# Altium project lga1700.PrjPCB (part 8 of 11)

## Sheet PCH_PWR - 0.82V_1.05V_1.8V.schdoc
size 594 x 421 mm; Symbol: Sheet-Symbol_A2; Company: 嘉立创EDA; Version: V1.0; Page Size: A2; @Project Name: H610(2024/12/09); @Page Count: 36; @Update Date: 2025-10-09; @Create Date: 2025-10-09; @Schematic Name: SCHEMATIC1; @Page No: 35; @Page Name: PCH_PWR - 0.82V/1.05V/1.8V; Device: Sheet-Symbol_A2; @Board Name: SCHEMATIC1; @Create Time: 10:15:43; @Update Time: 10:18:21
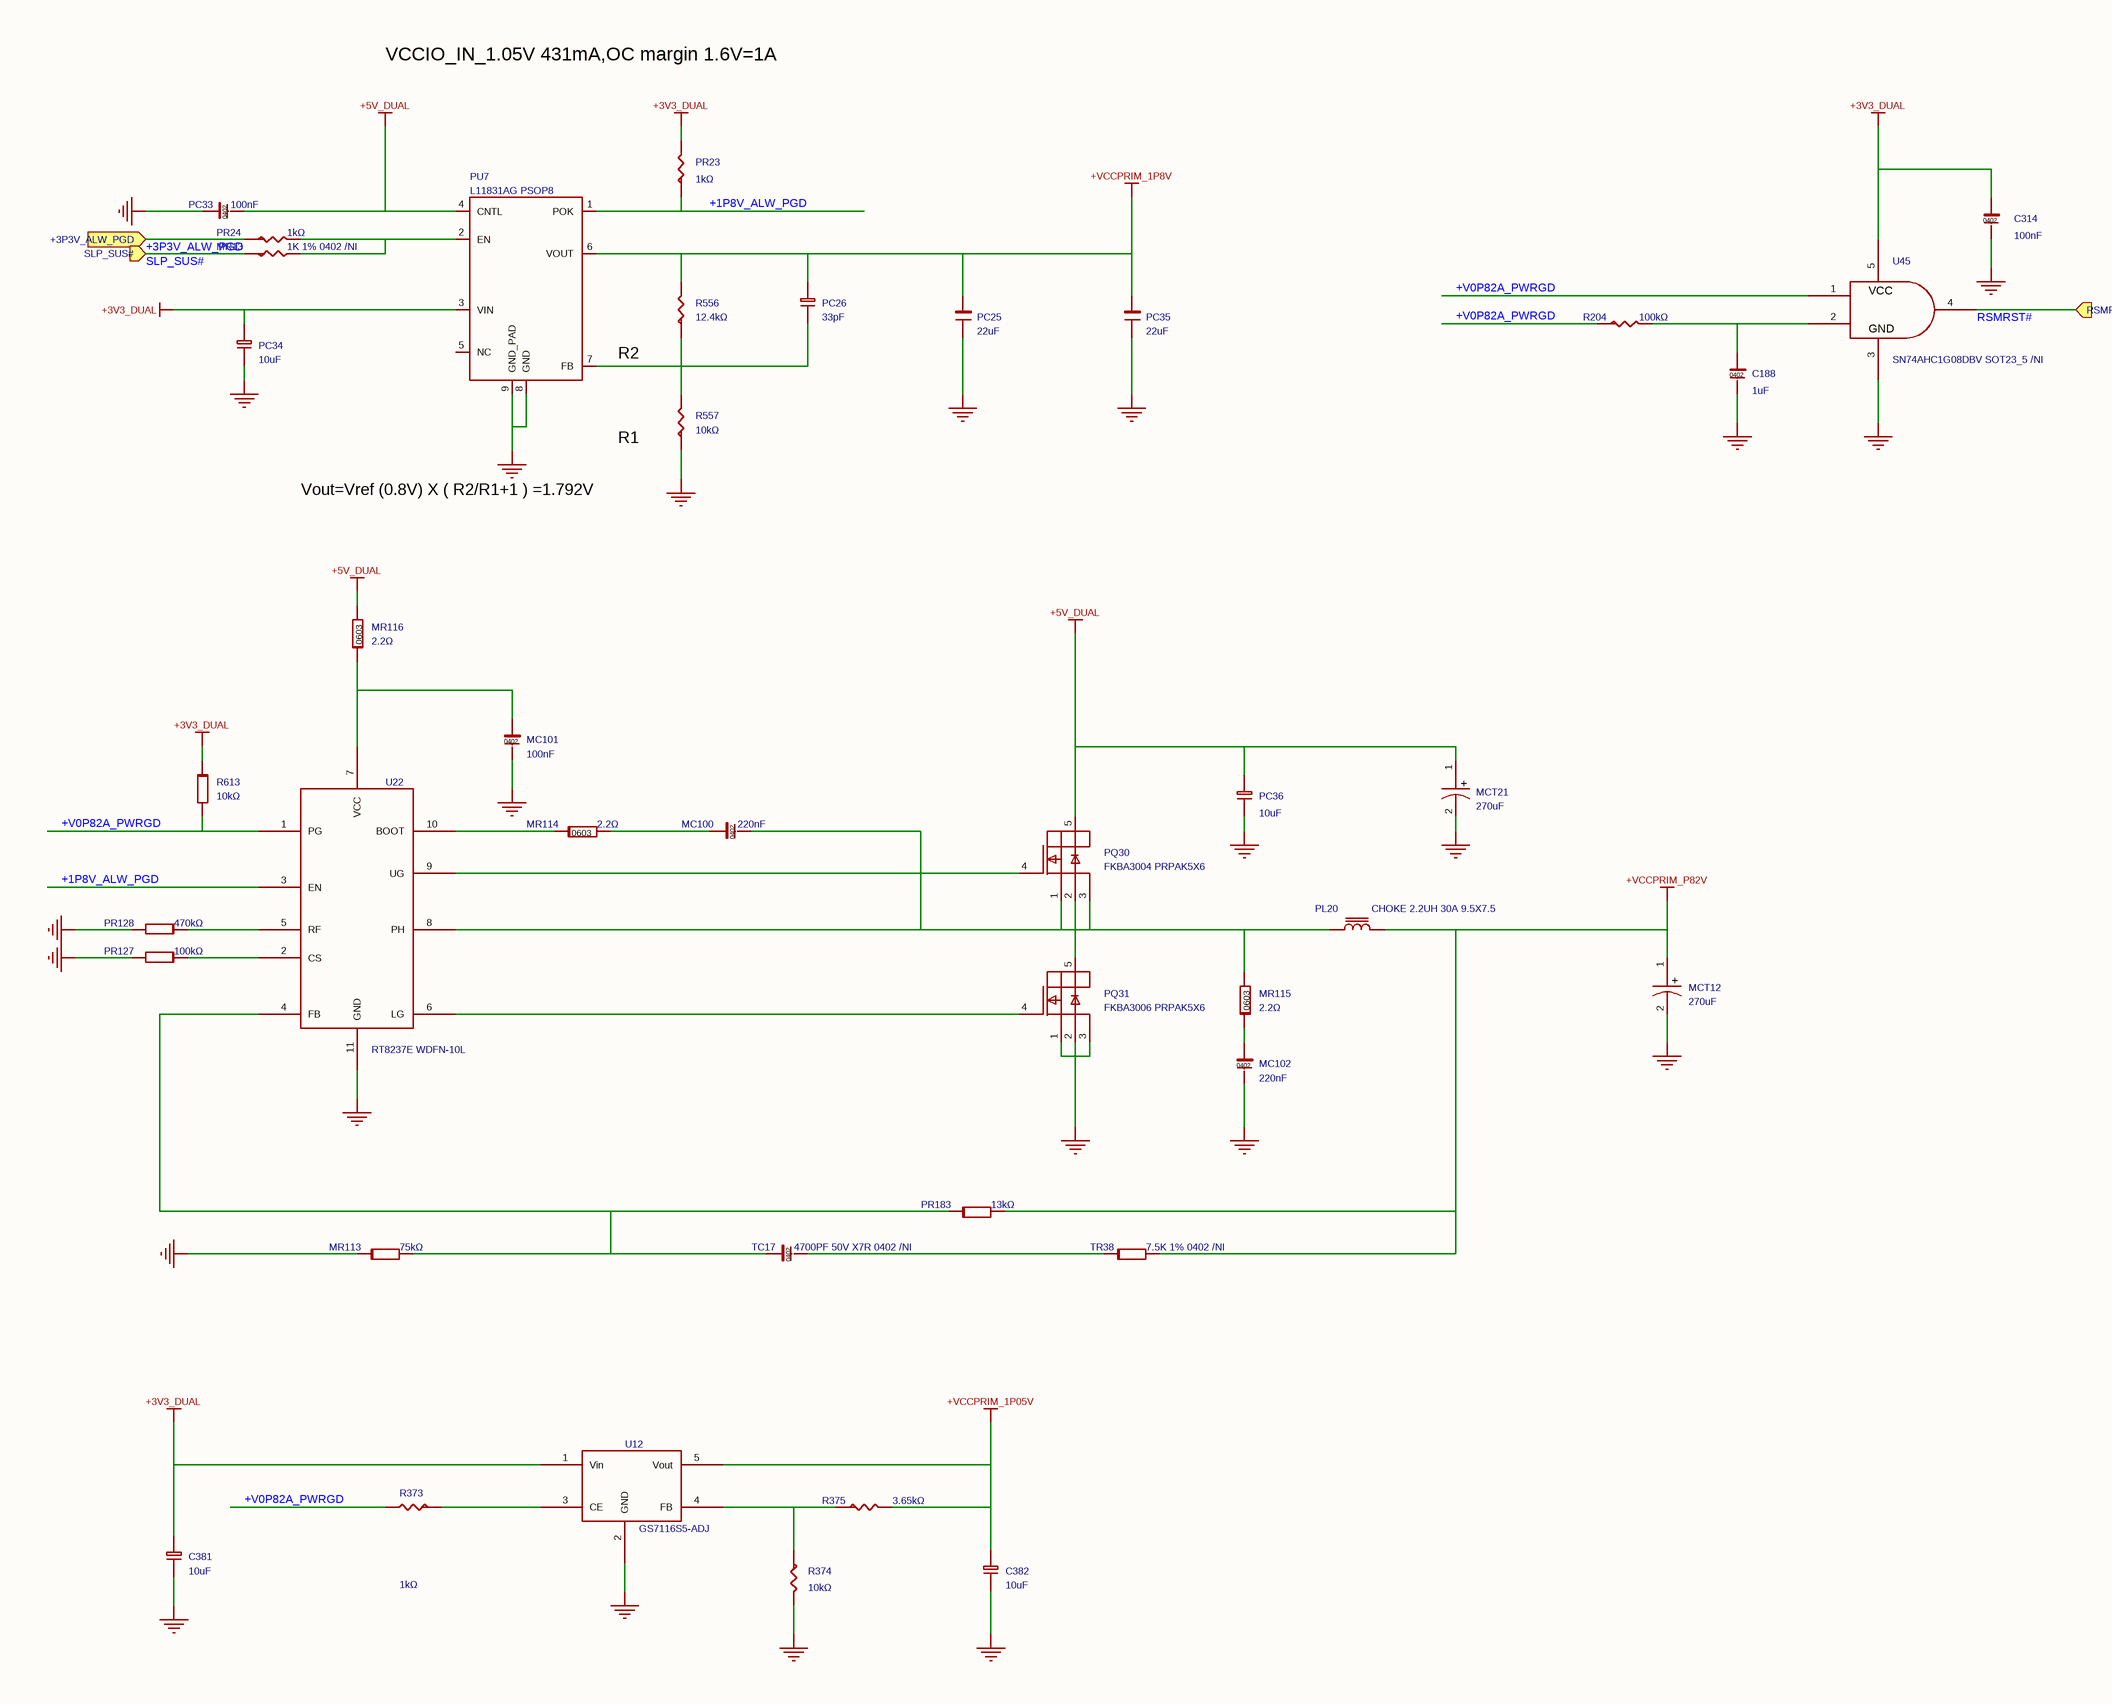
[diagram p27: PCH_PWR - 0.82V_1.05V_1.8V.schdoc]

### Parts
C188  1uF  [C0402_2]
C314  100nF  [C0402_2]
C381  10uF  [C0603_2]
C382  10uF  [C0603_1]
MC100  220nF  [C0402_2]
MC101  100nF  [C0402]
MC102  220nF  [C0402_1]
MCT12  270uF  [EC1P25C_2]
MCT21  270uF  [EC1P25C_2]
MR13  value 1K 1% 0402 /NI  [R0402_3]  (hidden comment: R-0603)
MR113  75kΩ  [R0402]
MR114  2.2Ω  [R0603]
MR115  2.2Ω  [R0603_2]
MR116  2.2Ω  [R0603]
PC25  22uF  [C0603_2]
PC26  33pF  [C0402_1]
PC33  100nF  [C0402_2]
PC34  10uF  [C0603_1]
PC35  22uF  [C0603_2]
PC36  10uF  [C0805_1]
PL20  value CHOKE 2.2UH 30A 9.5X7.5  [CHOKE2U8-20A_3P_1]  (hidden comment: L_L70-P50-H70)
PQ30  value FKBA3004 PRPAK5X6  [PRPAK5X6_6]  (hidden comment: PK616BA)
PQ31  value FKBA3006 PRPAK5X6  [PRPAK5X6_6]  (hidden comment: PK616BA)
PR23  1kΩ  [R0402]
PR24  1kΩ  [R0402_2]
PR127  100kΩ  [R0402_2]
PR128  470kΩ  [R0402_2]
PR183  13kΩ  [R0402_3]
PU7  value L11831AG PSOP8  [SO8_50_150GV_1]  (hidden comment: RT9173B_0)
R204  100kΩ  [R0402]
R373  1kΩ  [R0402_1]
R374  10kΩ  [R0402_3]
R375  3.65kΩ  [R0402_1]
R556  12.4kΩ  [R0402_3]
R557  10kΩ  [R0402]
R613  10kΩ  [R0402_2]
TC17  value 4700PF 50V X7R 0402 /NI  [C0402_2]  (hidden comment: C0402)
TR38  value 7.5K 1% 0402 /NI  [R0402_3]  (hidden comment: R0402)
U12  value GS7116S5-ADJ  [SM_SOT23_5PIN]  (hidden comment: 2280005000G_0)
U22  value RT8237E WDFN-10L  [DFN3X3-10-0-5_2]  (hidden comment: RT8237EZQW)
U45  value SN74AHC1G08DBV SOT23_5 /NI  [SM_SOT23_5PIN]  (hidden comment: 74AHC1G08_2)

### Ports
+3P3V_ALW_PGD (in), RSMRST# (in), SLP_SUS# (in)

### Nets
+3V3_DUAL: C314.1 C381.1 PC34.1 PR23.2 PU7.3(VIN) R613.1 U12.1(Vin) U45.5(VCC)
+5V_DUAL: MCT21.1 MR116.2 PC33.2 PC36.2 PQ30.5(DRAIN1) PU7.4(CNTL)
+VCCPRIM_1P05V: C382.1 R375.2 U12.5(Vout)
+VCCPRIM_1P8V: PC25.1 PC26.2 PC35.1 PU7.6(VOUT) R556.2
+VCCPRIM_P82V: MCT12.1 PL20.2 PR183.2 TR38.2
GND: C188.2 C314.2 C381.2 C382.2 MC101.2 MC102.2 MCT12.2 MCT21.2 MR113.1 PC25.2 PC33.1 PC34.2 PC35.2 PC36.1 PQ31.1(SOURCE1) PQ31.2(SOURCE2) PQ31.3(SOURCE3) PR127.2 PR128.2 PU7.8(GND) PU7.9(GND_PAD) R374.2 R557.1 U12.2(GND) U22.11(GND) U45.3(GND)
+1P8V_ALW_PGD: PR23.1 PU7.1(POK) U22.3(EN)
+3P3V_ALW_PGD: PR24.1 ; port +3P3V_ALW_PGD
+V0P82A_PWRGD: R204.1 R373.2 R613.2 U22.1(PG) U45.1(I0)
RSMRST#: U45.4(O) ; port RSMRST#
SLP_SUS#: MR13.1 ; port SLP_SUS#
NetC188_1: C188.1 R204.2 U45.2(I1)
NetMC100_1: MC100.1 MR114.2
NetMC100_2: MC100.2 MR115.2 PL20.1 PQ30.1(SOURCE1) PQ30.2(SOURCE2) PQ30.3(SOURCE3) PQ31.5(DRAIN1) U22.8(PH)
NetMC101_1: MC101.1 MR116.1 U22.7(VCC)
NetMC102_1: MC102.1 MR115.1
NetMR13_2: MR13.2 PR24.2 PU7.2(EN)
NetMR113_2: MR113.2 PR183.1 TC17.1 U22.4(FB)
NetMR114_1: MR114.1 U22.10(BOOT)
NetPC26_1: PC26.1 PU7.7(FB) R556.1 R557.2
NetPQ30_4: PQ30.4(GATE) U22.9(UG)
NetPQ31_4: PQ31.4(GATE) U22.6(LG)
NetPR127_1: PR127.1 U22.2(CS)
NetPR128_1: PR128.1 U22.5(RF)
NetR373_1: R373.1 U12.3(CE)
NetR374_1: R374.1 R375.1 U12.4(FB)
NetTC17_2: TC17.2 TR38.1

Not connected (* = marked no-connect by the designer): PU7 5(NC)

### Notes on the sheet
- VCCIO_IN_1.05V 431mA,OC margin 1.6V=1A
- R2
- R1
- Vout=Vref (0.8V) X ( R2/R1+1 ) =1.792V
- 更新日期
- 2025-10-09
- 原理图
- 图页
- SCHEMATIC1
- PCH_PWR - 0.82V/1.05V/1.8V
- 创建日期
- 物料编码
- 审阅
- 绘制
- H610(2024/12/09)
- 版本
- V1.0
- 尺寸
- A2
- 页
- 35
- 嘉立创EDA
- 共
- 36
- (in symbol 160AREC271M0609) +

### Library data of the parts
C188 = CL05A105KQ5NNNC: 容值:1uF;精度:±10%;额定电压:6.3V;材质(温度系数):X5R;; Manufacturer: SAMSUNG(三星); Symbol: C0402; AddInBom: yes; ModelId: 36a51122f27c49738f86b3bfa98863e0; ModelName: C0402_L1.0-W0.5-H0.5; ModelTransform: 39.37,19.685,0,0,0,0,0,0,0; Tolerance: ±10%; Voltage Rated: 6.3V; Temperature Coefficient: X5R; Device: CL05A105KQ5NNNC; Value: 1uF; LCSC Part Name: 1uF ±10% 6.3V; SupplierPart: C107372; ManufacturerPart: CL05A105KQ5NNNC; Supplier Footprint: 0402; JLCPCB Part Class: Extended Part; Datasheet: https://atta.szlcsc.com/upload/public/pdf/source/20160218/1457707763339.pdf; Supplier: LCSC; ConvertToPcb: yes; FootprintName: C0402_2
C314 PC33 = CL05B104KO5NNNC: as C237-C240 on sheet LAN - RTL8111H; Device: CL05B104KO5NNNC; Value: 100nF; Supplier: LCSC; Datasheet: https://atta.szlcsc.com/upload/public/pdf/source/20160103/1457707674891.pdf; FootprintName: C0402_2; SupplierPart: C1525; ConvertToPcb: yes; LCSC Part Name: 100nF ±10% 16V; JLCPCB Part Class: Basic Part; ManufacturerPart: CL05B104KO5NNNC; Supplier Footprint: 0402
C381 C382 PC34 = CL10A106MQ8NNNC: 容值:10uF;精度:±20%;额定电压:6.3V;材质(温度系数):X5R;; Manufacturer: SAMSUNG(三星); Symbol: CAP; PCB Footprint: C0603; Tolerance: ±20%; ModelId: ac125912035d415993ca9572d50418b1; AddInBom: yes; Voltage Rated: 6.3V; ModelName: C0603_L1.6-W0.8-H0.8; ModelTransform: 62.992,31.496,0,0,0,0,0,0,0; Temperature Coefficient: X5R; Device: CL10A106MQ8NNNC; Value: 10uF; Supplier: LCSC; Datasheet: https://atta.szlcsc.com/upload/public/pdf/source/20160103/1457707690948.pdf; SupplierPart: C1691; ConvertToPcb: yes; LCSC Part Name: 10uF ±20% 6.3V; JLCPCB Part Class: Extended Part; ManufacturerPart: CL10A106MQ8NNNC; Supplier Footprint: 0603
  C381: FootprintName: C0603_2
  C382 PC34: FootprintName: C0603_1
MC100 MC102 = CL05B224KO5NNNC: 容值:220nF;精度:±10%;额定电压:16V;材质(温度系数):X7R;; Manufacturer: SAMSUNG(三星); Symbol: C0402; ModelId: 36a51122f27c49738f86b3bfa98863e0; Tolerance: ±10%; AddInBom: yes; Voltage Rated: 16V; ModelName: C0402_L1.0-W0.5-H0.5; ModelTransform: 39.37,19.685,0,0,0,0,0,0,0; Temperature Coefficient: X7R; Device: CL05B224KO5NNNC; Value: 220nF; Supplier: LCSC; Datasheet: https://atta.szlcsc.com/upload/public/pdf/source/20160103/1457707689724.pdf; SupplierPart: C16772; ConvertToPcb: yes; LCSC Part Name: 220nF ±10% 16V; JLCPCB Part Class: Basic Part; ManufacturerPart: CL05B224KO5NNNC; Supplier Footprint: 0402
  MC100: FootprintName: C0402_2
  MC102: FootprintName: C0402_1
MC101 = CL05B104KO5NNNC: as C334 on sheet M.2_SATA_SLOT; Device: CL05B104KO5NNNC; Symbol: C0402; Value: 100nF; Supplier: LCSC; Datasheet: https://atta.szlcsc.com/upload/public/pdf/source/20160103/1457707674891.pdf; FootprintName: C0402; SupplierPart: C1525; ConvertToPcb: yes; LCSC Part Name: 100nF ±10% 16V; JLCPCB Part Class: Basic Part; ManufacturerPart: CL05B104KO5NNNC; Supplier Footprint: 0402
MCT12 MCT21 = 160AREC271M0609: 容值:270uF;精度:±20%;额定电压:16V;纹波电流:3.8A@100kHz;等效串联电阻:15mΩ@100kHz~300kHz;类型:-;; Manufacturer: APAQ(钰邦); Symbol: CAPACITOR POL_0; AddInBom: yes; ModelId: 0a4db4bf24b443b3be4905be97ff10c5; ModelName: CAP-TH_BD6.3-P2.50-D1.0-FD; ModelTransform: 248.4247,247.99777,0,0,0,0,0,0,-137.795; Tolerance: ±20%; Rated Voltage: 16V; φD: 6.3mm; L: 9mm; Lifetime @ Temp: 2000hrs@105℃; Device: 160AREC271M0609; Value: 270uF; LCSC Part Name: 270uF ±20% 16V; SupplierPart: C176312; ManufacturerPart: 160AREC271M0609; Supplier Footprint: 插件,D6.3xL9mm; JLCPCB Part Class: Extended Part; Datasheet: https://atta.szlcsc.com/upload/public/pdf/source/20180420/C176312_A6CC051F3F5535015096354530D22B11.pdf; Supplier: LCSC; ConvertToPcb: yes; FootprintName: EC1P25C_2; Ripple Current: 3.8A@100kHz; Equivalent Series Resistance(ESR): 15mΩ@100kHz~300kHz; Type: -; Lead Spacing: 2.5mm; Operating Temperature: -55℃~+105℃
MR13 = R-0603: Check: false; AddInBom: yes; Device: R-0603; Symbol: R-0603; FootprintName: R0402_3; ConvertToPcb: yes
MR113 = 0402WGF7502TCE: 电阻类型:厚膜电阻;阻值:75kΩ;精度:±1%;功率:62.5mW;; Manufacturer: UNI-ROYAL(厚声); ModelId: 671aefced39d4c318694bba8bd8efd39; Tolerance: ±1%; AddInBom: yes; Power(Watts): 62.5mW; ModelName: R0402_L1.0-W0.5-H0.5; ModelTransform: 39.37,19.685,0,0,0,0,0,0.0005,0; Overload Voltage (Max): 50V; Temperature Coefficient: ±100ppm/℃; Device: 0402WGF7502TCE; Symbol: R0402; Value: 75kΩ; Type: 厚膜电阻; Supplier: LCSC; Datasheet: https://atta.szlcsc.com/upload/public/pdf/source/20200306/C422600_1E6D84923E4A46A82E41ADD87F860B5C.pdf; FootprintName: R0402; SupplierPart: C25798; ConvertToPcb: yes; LCSC Part Name: 75kΩ ±1% 62.5mW; JLCPCB Part Class: Basic Part; ManufacturerPart: 0402WGF7502TCE; Supplier Footprint: 0402; Operating Temperature Range: -55℃~+155℃
MR114 MR116 = 0603WAF220KT5E: 电阻类型:厚膜电阻;阻值:2.2Ω;精度:±1%;功率:100mW;; Manufacturer: UNI-ROYAL(厚声); ModelId: fc143cca1e79419f9cd78b61e9279f08; Tolerance: ±1%; AddInBom: yes; Power(Watts): 100mW; ModelTransform: 31.8897,63.7794,0,90,0,0,0,0,0; Overload Voltage (Max): 75V; Temperature Coefficient: ±400ppm/℃; Device: 0603WAF220KT5E; Symbol: R0603; Value: 2.2Ω; Type: 厚膜电阻; Supplier: LCSC; Datasheet: https://atta.szlcsc.com/upload/public/pdf/source/20200306/C422600_1E6D84923E4A46A82E41ADD87F860B5C.pdf; FootprintName: R0603; SupplierPart: C22939; ModelName: R0603; ConvertToPcb: yes; LCSC Part Name: 2.2Ω ±1% 100mW; JLCPCB Part Class: Basic Part; ManufacturerPart: 0603WAF220KT5E; Supplier Footprint: 0603; Operating Temperature Range: -55℃~+155℃
MR115 = 0603WAF220KT5E: 电阻类型:厚膜电阻;阻值:2.2Ω;精度:±1%;功率:100mW;; Manufacturer: UNI-ROYAL(厚声); Symbol: R0603; ModelId: fc143cca1e79419f9cd78b61e9279f08; Tolerance: ±1%; AddInBom: yes; Power(Watts): 100mW; ModelTransform: 31.8897,63.7794,0,90,0,0,0,0,0; Overload Voltage (Max): 75V; Temperature Coefficient: ±400ppm/℃; Device: 0603WAF220KT5E; Value: 2.2Ω; Type: 厚膜电阻; Supplier: LCSC; Datasheet: https://atta.szlcsc.com/upload/public/pdf/source/20200306/C422600_1E6D84923E4A46A82E41ADD87F860B5C.pdf; FootprintName: R0603_2; SupplierPart: C22939; ModelName: R0603; ConvertToPcb: yes; LCSC Part Name: 2.2Ω ±1% 100mW; JLCPCB Part Class: Basic Part; ManufacturerPart: 0603WAF220KT5E; Supplier Footprint: 0603; Operating Temperature Range: -55℃~+155℃
PC25 PC35 = CL10A226MQ8NRNC: as C330 on sheet M.2_SATA_SLOT; Device: CL10A226MQ8NRNC; Value: 22uF; LCSC Part Name: 22uF ±20% 6.3V; SupplierPart: C59461; ManufacturerPart: CL10A226MQ8NRNC; Supplier Footprint: 0603; JLCPCB Part Class: Basic Part; Datasheet: https://atta.szlcsc.com/upload/public/pdf/source/20160218/1457707763339.pdf; Supplier: LCSC; ConvertToPcb: yes; FootprintName: C0603_2
PC26 = CC0402JRNPO9BN330: 容值:33pF;精度:±5%;额定电压:50V;材质(温度系数):NP0;; Manufacturer: YAGEO(国巨); Symbol: C-0603_3; ModelId: 36a51122f27c49738f86b3bfa98863e0; Tolerance: ±5%; AddInBom: yes; Voltage Rated: 50V; ModelName: C0402_L1.0-W0.5-H0.5; ModelTransform: 39.37,19.685,0,0,0,0,0,0,0; Temperature Coefficient: NP0; Device: CC0402JRNPO9BN330; Value: 33pF; Supplier: LCSC; Datasheet: https://atta.szlcsc.com/upload/public/pdf/source/20171026/C107005_15089856307561059550.pdf; FootprintName: C0402_1; SupplierPart: C107005; ConvertToPcb: yes; LCSC Part Name: 33pF ±5% 50V; JLCPCB Part Class: Extended Part; ManufacturerPart: CC0402JRNPO9BN330; Supplier Footprint: 0402
PC36 = CL21A106KOQNNNE: 容值:10uF;精度:±10%;额定电压:16V;材质(温度系数):X5R;; Manufacturer: SAMSUNG(三星); Symbol: CAP NP_31; ModelId: 1ba041120af144c991958decab20d241; Tolerance: ±10%; AddInBom: yes; Voltage Rated: 16V; ModelName: C0805_L2.0-W1.3-H1.3; ModelTransform: 78.74,51.181,0,0,0,0,0,0.0005,0; Temperature Coefficient: X5R; Device: CL21A106KOQNNNE; Value: 10uF; Supplier: LCSC; Datasheet: https://atta.szlcsc.com/upload/public/pdf/source/20160103/1457707694240.pdf; FootprintName: C0805_1; SupplierPart: C1713; ConvertToPcb: yes; LCSC Part Name: 10uF ±10% 16V; JLCPCB Part Class: Extended Part; ManufacturerPart: CL21A106KOQNNNE; Supplier Footprint: 0805
PL20 = L_L70-P50-H70: 2R8一体成型直插电感; Check: false; AddInBom: yes; Device: L_L70-P50-H70; Symbol: L_L70-P50-H70; FootprintName: CHOKE2U8-20A_3P_1; ConvertToPcb: yes
PQ30 PQ31 = PK616BA: 类型:1个N沟道;漏源电压(Vdss):30V;连续漏极电流(Id):50A;功率(Pd):31W;导通电阻(RDS(on)@Vgs,Id):9.5mΩ@4.5V,13A;阈值电压(Vgs(th)@Id):3V@250uA;; Manufacturer: NIKO-SEM(尼克森); Symbol: MOS-N_SO8_3; AddInBom: yes; ModelId: 178189b27e7544aca50c111426555358; ModelName: PDFN-8_L4.9-W5.8-H1.0-P1.27; ModelTransform: 200.787,240.157,0,0,0,0,-0.097,0,0; Drain Source Voltage (Vdss): 30V; Continuous Drain Current (Id): 50A; Power Dissipation (Pd): 31W; Device: PK616BA; LCSC Part Name: 1个N沟道 耐压:30V 电流:50A; SupplierPart: C133608; ManufacturerPart: PK616BA; Supplier Footprint: PDFN-8(5.8x4.9); JLCPCB Part Class: Extended Part; Datasheet: https://atta.szlcsc.com/upload/public/pdf/source/20170930/C133608_1506736454344997453.pdf; Supplier: LCSC; ConvertToPcb: yes; FootprintName: PRPAK5X6_6; Type: 1个N沟道; Drain Source On Resistance (RDS(on)@Vgs,Id): 9.5mΩ@4.5V,13A; Gate Threshold Voltage (Vgs(th)@Id): 3V@250uA
PR23 PR24 = 0402WGF1001TCE: 电阻类型:厚膜电阻;阻值:1kΩ;精度:±1%;功率:62.5mW;; Manufacturer: UNI-ROYAL(厚声); Symbol: R-0603_0; ModelId: 671aefced39d4c318694bba8bd8efd39; Tolerance: ±1%; AddInBom: yes; Power(Watts): 62.5mW; ModelName: R0402_L1.0-W0.5-H0.5; ModelTransform: 39.37,19.685,0,0,0,0,0,0.0005,0; Overload Voltage (Max): 50V; Temperature Coefficient: ±100ppm/℃; Device: 0402WGF1001TCE; Value: 1kΩ; Type: 厚膜电阻; Supplier: LCSC; Datasheet: https://atta.szlcsc.com/upload/public/pdf/source/20200306/C422600_1E6D84923E4A46A82E41ADD87F860B5C.pdf; SupplierPart: C11702; ConvertToPcb: yes; LCSC Part Name: 1kΩ ±1% 62.5mW; JLCPCB Part Class: Basic Part; ManufacturerPart: 0402WGF1001TCE; Supplier Footprint: 0402; Operating Temperature Range: -55℃~+155℃
  PR23: FootprintName: R0402
  PR24: FootprintName: R0402_2
PR127 = 0402WGF1003TCE: 电阻类型:厚膜电阻;阻值:100kΩ;精度:±1%;功率:62.5mW;; Manufacturer: UNI-ROYAL(厚声); Symbol: R0402; ModelId: 671aefced39d4c318694bba8bd8efd39; Tolerance: ±1%; AddInBom: yes; Power(Watts): 62.5mW; ModelName: R0402_L1.0-W0.5-H0.5; ModelTransform: 39.37,19.685,0,0,0,0,0,0.0005,0; Overload Voltage (Max): 50V; Temperature Coefficient: ±100ppm/℃; Device: 0402WGF1003TCE; Value: 100kΩ; Type: 厚膜电阻; Supplier: LCSC; Datasheet: https://atta.szlcsc.com/upload/public/pdf/source/20200306/C422600_1E6D84923E4A46A82E41ADD87F860B5C.pdf; FootprintName: R0402_2; SupplierPart: C25741; ConvertToPcb: yes; LCSC Part Name: 100kΩ ±1% 62.5mW; JLCPCB Part Class: Basic Part; ManufacturerPart: 0402WGF1003TCE; Supplier Footprint: 0402; Operating Temperature Range: -55℃~+155℃
PR128 = 0402WGF4703TCE: 电阻类型:厚膜电阻;阻值:470kΩ;精度:±1%;功率:62.5mW;; Manufacturer: UNI-ROYAL(厚声); Symbol: R0402; ModelId: 671aefced39d4c318694bba8bd8efd39; Tolerance: ±1%; AddInBom: yes; Power(Watts): 62.5mW; ModelName: R0402_L1.0-W0.5-H0.5; ModelTransform: 39.37,19.685,0,0,0,0,0,0.0005,0; Overload Voltage (Max): 50V; Temperature Coefficient: ±100ppm/℃; Device: 0402WGF4703TCE; Value: 470kΩ; Type: 厚膜电阻; Supplier: LCSC; Datasheet: https://atta.szlcsc.com/upload/public/pdf/source/20200306/C422600_1E6D84923E4A46A82E41ADD87F860B5C.pdf; FootprintName: R0402_2; SupplierPart: C25790; ConvertToPcb: yes; LCSC Part Name: 470kΩ ±1% 62.5mW; JLCPCB Part Class: Basic Part; ManufacturerPart: 0402WGF4703TCE; Supplier Footprint: 0402; Operating Temperature Range: -55℃~+155℃
PR183 = 0402WGF1302TCE: 电阻类型:厚膜电阻;阻值:13kΩ;精度:±1%;功率:62.5mW;; Manufacturer: UNI-ROYAL(厚声); Symbol: R0402; ModelId: 671aefced39d4c318694bba8bd8efd39; Tolerance: ±1%; AddInBom: yes; Power(Watts): 62.5mW; ModelName: R0402_L1.0-W0.5-H0.5; ModelTransform: 39.37,19.685,0,0,0,0,0,0.0005,0; Overload Voltage (Max): 50V; Temperature Coefficient: ±100ppm/℃; Device: 0402WGF1302TCE; Value: 13kΩ; Type: 厚膜电阻; Supplier: LCSC; Datasheet: https://atta.szlcsc.com/upload/public/pdf/source/20200306/C422600_1E6D84923E4A46A82E41ADD87F860B5C.pdf; FootprintName: R0402_3; SupplierPart: C25754; ConvertToPcb: yes; LCSC Part Name: 13kΩ ±1% 62.5mW; JLCPCB Part Class: Extended Part; ManufacturerPart: 0402WGF1302TCE; Supplier Footprint: 0402; Operating Temperature Range: -55℃~+155℃
PU7 = RT9173B_2: Check: false; AddInBom: yes; Device: RT9173B_2; Symbol: RT9173B_0; FootprintName: SO8_50_150GV_1; ConvertToPcb: yes
R204 = 0402WGF1003TCE: 电阻类型:厚膜电阻;阻值:100kΩ;精度:±1%;功率:62.5mW;; Manufacturer: UNI-ROYAL(厚声); Symbol: RESISTOR; ModelId: 671aefced39d4c318694bba8bd8efd39; Tolerance: ±1%; AddInBom: yes; Power(Watts): 62.5mW; ModelName: R0402_L1.0-W0.5-H0.5; ModelTransform: 39.37,19.685,0,0,0,0,0,0.0005,0; Overload Voltage (Max): 50V; Temperature Coefficient: ±100ppm/℃; Device: 0402WGF1003TCE; Value: 100kΩ; Type: 厚膜电阻; Supplier: LCSC; Datasheet: https://atta.szlcsc.com/upload/public/pdf/source/20200306/C422600_1E6D84923E4A46A82E41ADD87F860B5C.pdf; FootprintName: R0402; SupplierPart: C25741; ConvertToPcb: yes; LCSC Part Name: 100kΩ ±1% 62.5mW; JLCPCB Part Class: Basic Part; ManufacturerPart: 0402WGF1003TCE; Supplier Footprint: 0402; Operating Temperature Range: -55℃~+155℃
R373 = 0402WGF1001TCE: as LR4 on sheet LAN - RTL8111H; Value: 1kΩ; Device: 0402WGF1001TCE; Type: 厚膜电阻; Supplier: LCSC; Datasheet: https://atta.szlcsc.com/upload/public/pdf/source/20200306/C422600_1E6D84923E4A46A82E41ADD87F860B5C.pdf; FootprintName: R0402_1; SupplierPart: C11702; ConvertToPcb: yes; LCSC Part Name: 1kΩ ±1% 62.5mW; JLCPCB Part Class: Basic Part; ManufacturerPart: 0402WGF1001TCE; Supplier Footprint: 0402; Operating Temperature Range: -55℃~+155℃
R374 = 0402WGF1002TCE: 电阻类型:厚膜电阻;阻值:10kΩ;精度:±1%;功率:62.5mW;; Manufacturer: UNI-ROYAL(厚声); Symbol: R-0603; ModelId: 671aefced39d4c318694bba8bd8efd39; Tolerance: ±1%; AddInBom: yes; Power(Watts): 62.5mW; ModelName: R0402_L1.0-W0.5-H0.5; ModelTransform: 39.37,19.685,0,0,0,0,0,0.0005,0; Overload Voltage (Max): 50V; Temperature Coefficient: ±100ppm/℃; Device: 0402WGF1002TCE; Value: 10kΩ; Type: 厚膜电阻; Supplier: LCSC; Datasheet: https://atta.szlcsc.com/upload/public/pdf/source/20200306/C422600_1E6D84923E4A46A82E41ADD87F860B5C.pdf; FootprintName: R0402_3; SupplierPart: C25744; ConvertToPcb: yes; LCSC Part Name: 10kΩ ±1% 62.5mW; JLCPCB Part Class: Basic Part; ManufacturerPart: 0402WGF1002TCE; Supplier Footprint: 0402; Operating Temperature Range: -55℃~+155℃
R375 = ERJ2RKF3651X: 电阻类型:厚膜电阻;阻值:3.65kΩ;精度:±1%;功率:100mW;最大工作电压:100V;温度系数:±100ppm/℃;; Manufacturer: PANASONIC(松下); Symbol: R-0603; AddInBom: yes; ModelId: 671aefced39d4c318694bba8bd8efd39; ModelName: R0402_L1.0-W0.5-H0.5; ModelTransform: 39.37,19.685,0,0,0,0,0,0.0005,0; Tolerance: ±1%; Power(Watts): 100mW; Overload Voltage (Max): 100V; Device: ERJ2RKF3651X; Value: 3.65kΩ; LCSC Part Name: 3.65kΩ ±1% 100mW 厚膜电阻; SupplierPart: C416527; ManufacturerPart: ERJ2RKF3651X; Supplier Footprint: 0402; JLCPCB Part Class: Extended Part; Datasheet: https://atta.szlcsc.com/upload/public/pdf/source/20190902/C416527_C4564A8D72F3E2A9CDC3D7769B95121D.pdf; Supplier: LCSC; ConvertToPcb: yes; FootprintName: R0402_1; Type: 厚膜电阻; Temperature Coefficient: ±100ppm/℃; Operating Temperature Range: -55℃~+155℃
R556 = 0402WGF1242TCE: 电阻类型:厚膜电阻;阻值:12.4kΩ;精度:±1%;功率:62.5mW;; Manufacturer: UNI-ROYAL(厚声); Symbol: 42A**-F; PCB Footprint: R0402; ModelId: 671aefced39d4c318694bba8bd8efd39; Tolerance: ±1%; AddInBom: yes; Power(Watts): 62.5mW; ModelName: R0402_L1.0-W0.5-H0.5; ModelTransform: 39.37,19.685,0,0,0,0,0,0.0005,0; Overload Voltage (Max): 50V; Temperature Coefficient: ±100ppm/℃; Device: 0402WGF1242TCE; Value: 12.4kΩ; Type: 厚膜电阻; Supplier: LCSC; Datasheet: https://atta.szlcsc.com/upload/public/pdf/source/20200306/C422600_1E6D84923E4A46A82E41ADD87F860B5C.pdf; FootprintName: R0402_3; SupplierPart: C11692; ConvertToPcb: yes; LCSC Part Name: 12.4kΩ ±1% 62.5mW; JLCPCB Part Class: Extended Part; ManufacturerPart: 0402WGF1242TCE; Supplier Footprint: 0402; Operating Temperature Range: -55℃~+155℃
R557 = 0402WGF1002TCE: 电阻类型:厚膜电阻;阻值:10kΩ;精度:±1%;功率:62.5mW;; Manufacturer: UNI-ROYAL(厚声); Symbol: 42A**-F; ModelId: 671aefced39d4c318694bba8bd8efd39; Tolerance: ±1%; AddInBom: yes; Power(Watts): 62.5mW; ModelName: R0402_L1.0-W0.5-H0.5; ModelTransform: 39.37,19.685,0,0,0,0,0,0.0005,0; Overload Voltage (Max): 50V; Temperature Coefficient: ±100ppm/℃; Device: 0402WGF1002TCE; PCB Footprint: R0402; Value: 10kΩ; Type: 厚膜电阻; Supplier: LCSC; Datasheet: https://atta.szlcsc.com/upload/public/pdf/source/20200306/C422600_1E6D84923E4A46A82E41ADD87F860B5C.pdf; FootprintName: R0402; SupplierPart: C25744; ConvertToPcb: yes; LCSC Part Name: 10kΩ ±1% 62.5mW; JLCPCB Part Class: Basic Part; ManufacturerPart: 0402WGF1002TCE; Supplier Footprint: 0402; Operating Temperature Range: -55℃~+155℃
R613 = 0402WGF1002TCE: 电阻类型:厚膜电阻;阻值:10kΩ;精度:±1%;功率:62.5mW;; Manufacturer: UNI-ROYAL(厚声); Symbol: R0402; ModelId: 671aefced39d4c318694bba8bd8efd39; Tolerance: ±1%; AddInBom: yes; Power(Watts): 62.5mW; ModelName: R0402_L1.0-W0.5-H0.5; ModelTransform: 39.37,19.685,0,0,0,0,0,0.0005,0; Overload Voltage (Max): 50V; Temperature Coefficient: ±100ppm/℃; Device: 0402WGF1002TCE; Value: 10kΩ; Type: 厚膜电阻; Supplier: LCSC; Datasheet: https://atta.szlcsc.com/upload/public/pdf/source/20200306/C422600_1E6D84923E4A46A82E41ADD87F860B5C.pdf; FootprintName: R0402_2; SupplierPart: C25744; ConvertToPcb: yes; LCSC Part Name: 10kΩ ±1% 62.5mW; JLCPCB Part Class: Basic Part; ManufacturerPart: 0402WGF1002TCE; Supplier Footprint: 0402; Operating Temperature Range: -55℃~+155℃
TC17 = C0402_2: Manufacturer: FH(风华); Manufacturer Part: 0402B472K500NT; 3D Model Transform: 39.37,19.685,0,0,0,0,0,0,0; Tolerance: ±10%; Voltage Rated: 50V; Temperature Coefficient: X7R; ModelId: 222a10e09e6e477a9f85628e277082cb; AddInBom: yes; Device: C0402_2; Symbol: C0402; LCSC Part Name: 4.7nF ±10% 50V; Supplier Part: C1538; Supplier Footprint: 0402; JLCPCB Part Class: Basic Part; Datasheet: https://atta.szlcsc.com/upload/public/pdf/source/20200305/C486355_26A10D38EF8C2A5C37091D0039909270.pdf; Supplier: LCSC; FootprintName: C0402_2; ModelName: C0402; ConvertToPcb: yes
TR38 = R0402_1: Manufacturer: UNI-ROYAL(厚声); Manufacturer Part: 0402WGF7501TCE; 3D Model: 671aefced39d4c318694bba8bd8efd39; 3D Model Transform: 39.37,19.685,0,0,0,0,0,0.0005,0; Type: 厚膜电阻; Tolerance: ±1%; Power(Watts): 62.5mW; Overload Voltage (Max): 50V; Temperature Coefficient: ±100ppm/℃; AddInBom: yes; Device: R0402_1; Symbol: R0402; LCSC Part Name: 7.5kΩ ±1% 62.5mW 厚膜电阻; Supplier Part: C25918; Supplier Footprint: 0402; JLCPCB Part Class: Extended Part; Datasheet: https://atta.szlcsc.com/upload/public/pdf/source/20200306/C422600_1E6D84923E4A46A82E41ADD87F860B5C.pdf; Supplier: LCSC; Operating Temperature Range: -55℃~+155℃; FootprintName: R0402_3; ConvertToPcb: yes
U12 = 2280005000G_0: Check: false; AddInBom: yes; Device: 2280005000G_0; Symbol: 2280005000G_0; FootprintName: SM_SOT23_5PIN; ConvertToPcb: yes
U22 = RT8237EZQW: Manufacturer: RICHTEK(立锜); Symbol: uP6305 PSOP8_16; AddInBom: yes; ModelId: fa41748ee6fa4796aafe6110ca106f1f; ModelName: WDFN-10_L3.0-W3.0-H0.8-P0.50; ModelTransform: 118.11,118.8974,0,0,0,0,0,0,0; Device: RT8237EZQW; LCSC Part Name: High Efficiency Single Synchronous Buck PWM Controller; SupplierPart: C347517; ManufacturerPart: RT8237EZQW; Supplier Footprint: WDFN-10-EP(3x3); JLCPCB Part Class: Extended Part; Datasheet: https://atta.szlcsc.com/upload/public/pdf/source/20220608/C1907E879361D3C5D5346817D8A62D8C.pdf; Supplier: LCSC; ConvertToPcb: yes; FootprintName: DFN3X3-10-0-5_2
U45 = 74AHC1G08_2: Add into BOM: no; Check: false; ConvertToPcb: yes; Device: 74AHC1G08_2; Symbol: 74AHC1G08_2; FootprintName: SM_SOT23_5PIN

## Sheet PEG_PCIEX1 SLOT.schdoc
size 420 x 298 mm; Symbol: Sheet-Symbol_A3; Company: 嘉立创EDA; Version: V1.0; Page Size: A3; @Project Name: 【全网首发】X86电脑主板_copy; @Page Count: 17; @Update Date: 2025-10-09; @Create Date: 2025-10-09; @Schematic Name: SCHEMATIC1_1; @Page No: 0; @Page Name: PEG/PCIEX1 SLOT; Device: Sheet-Symbol_A3
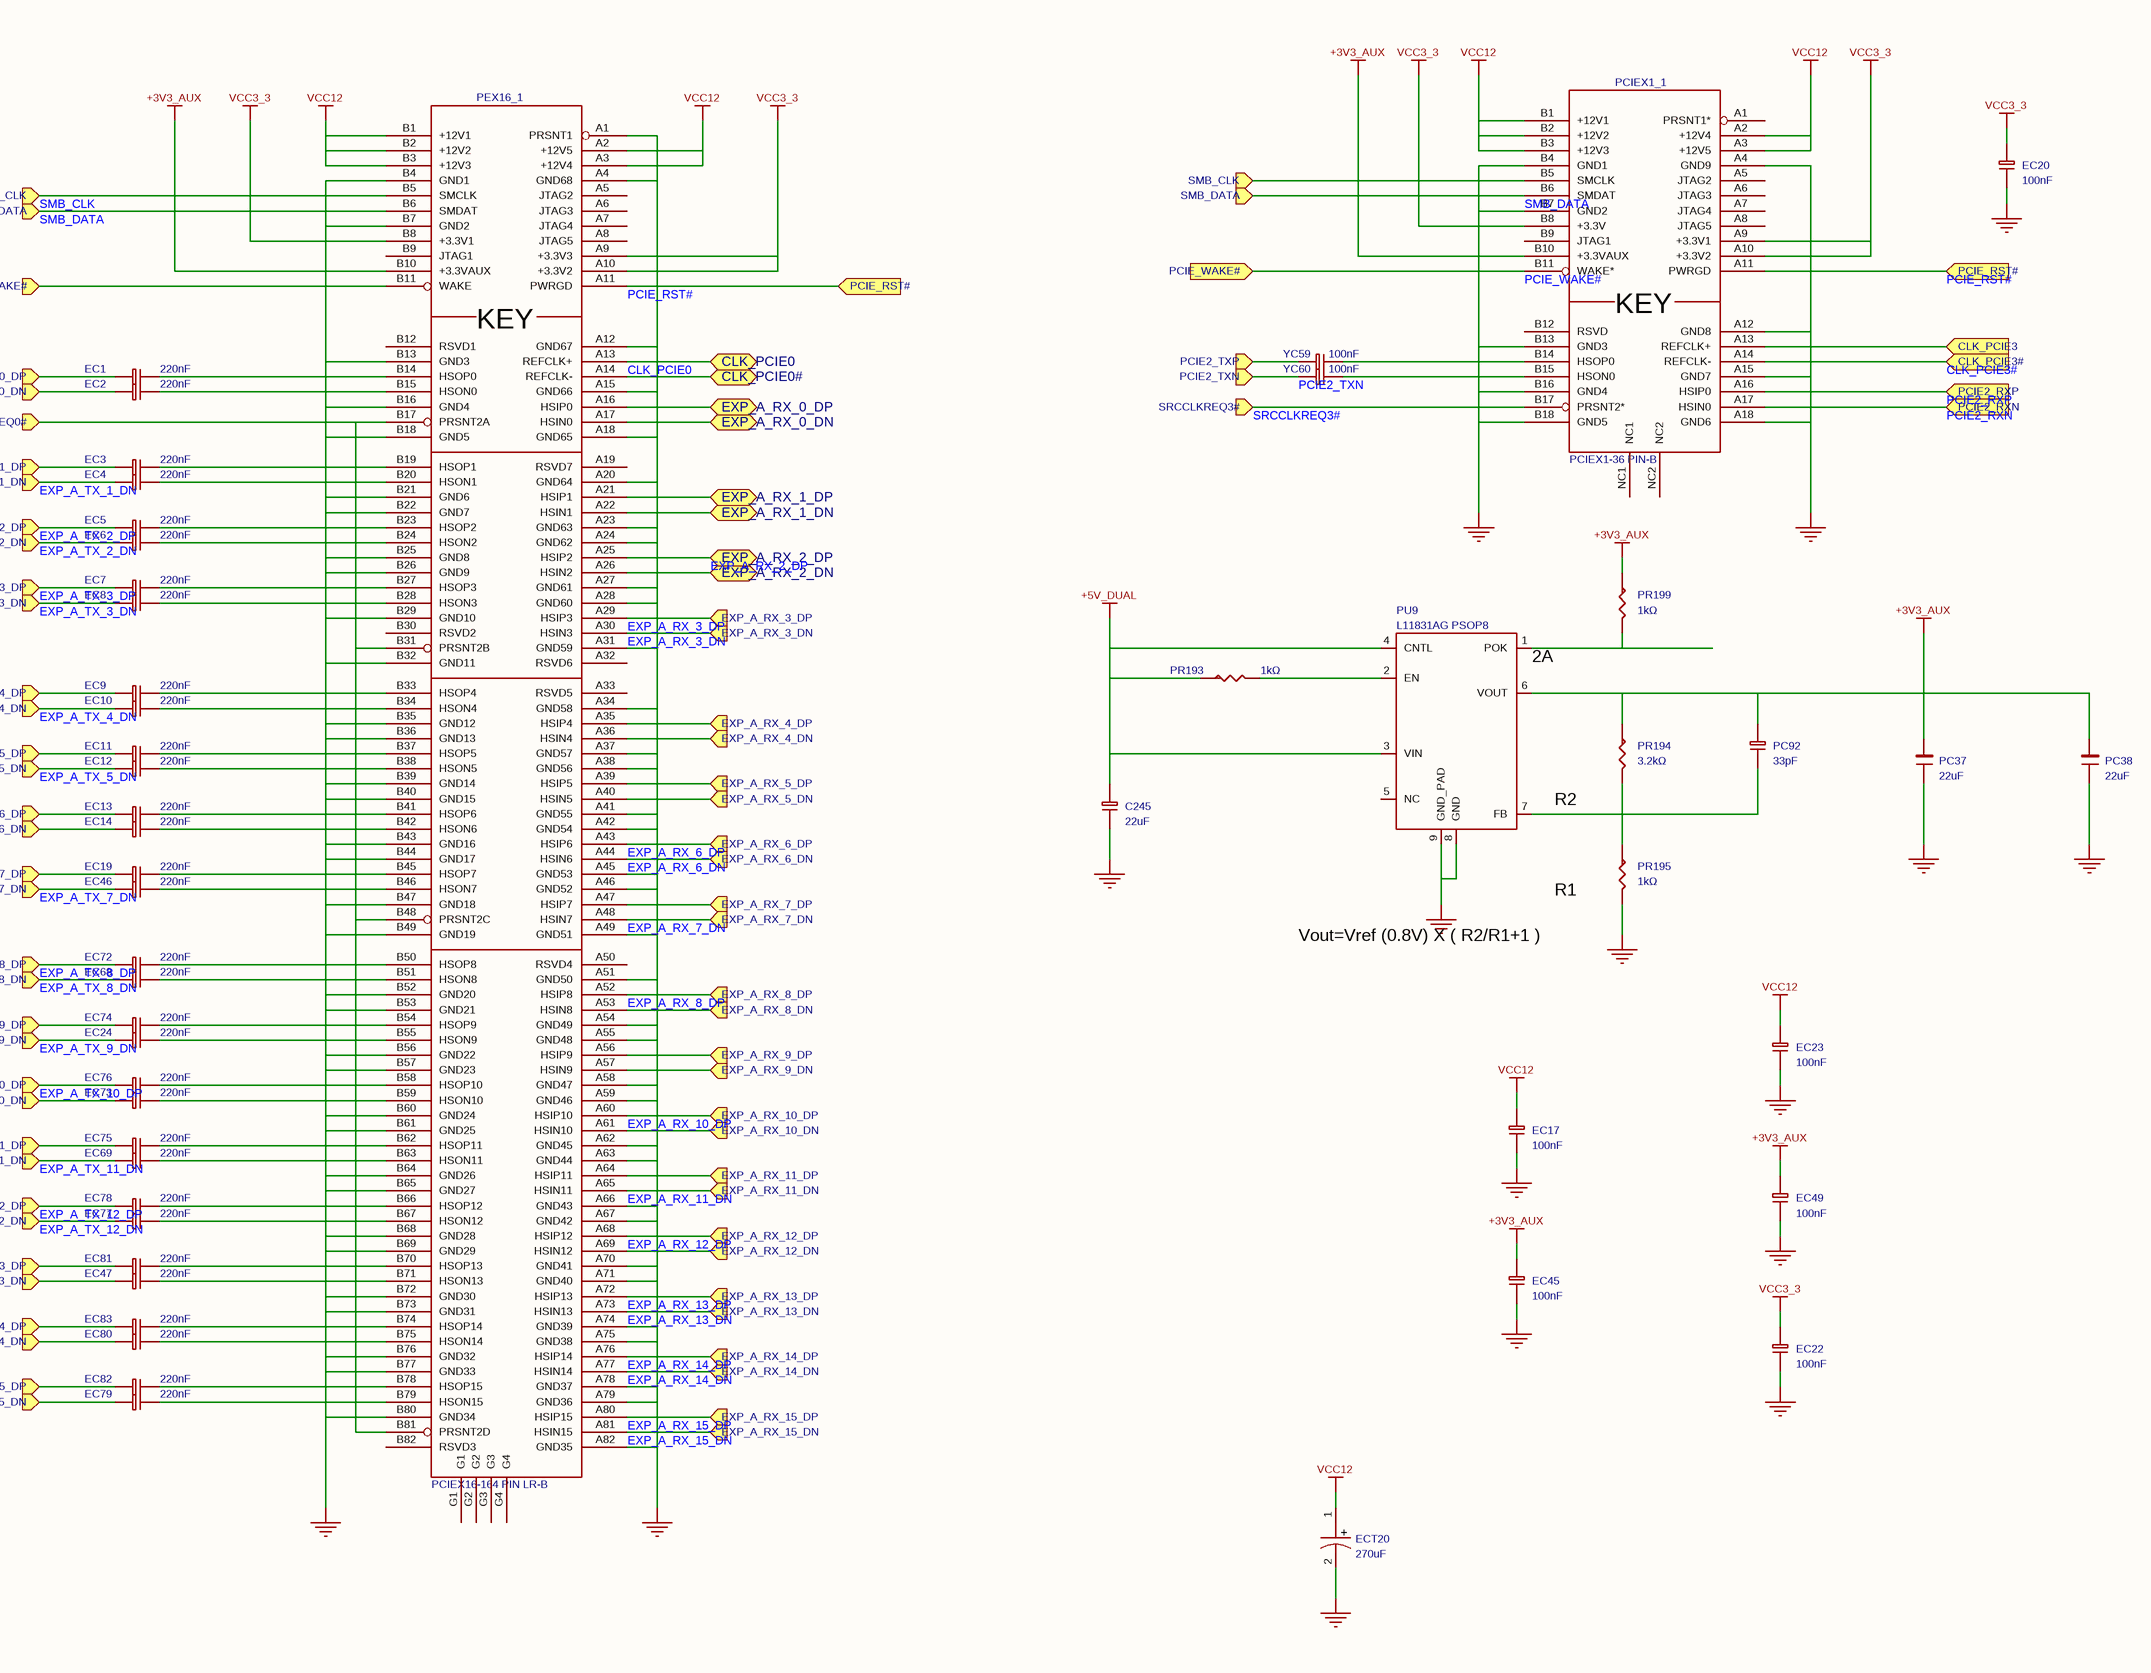
[diagram p28: PEG_PCIEX1 SLOT.schdoc]

### Parts
C245  22uF  [C0603_2]
EC1  220nF  [C0402_1]
EC2  220nF  [C0402_1]
EC3  220nF  [C0402_1]
EC4  220nF  [C0402_1]
EC5  220nF  [C0402_1]
EC6  220nF  [C0402_1]
EC7  220nF  [C0402_1]
EC8  220nF  [C0402_1]
EC9  220nF  [C0402_1]
EC10  220nF  [C0402_1]
EC11  220nF  [C0402_1]
EC12  220nF  [C0402_1]
EC13  220nF  [C0402_1]
EC14  220nF  [C0402_1]
EC17  100nF  [C0402_1]
EC19  220nF  [C0402_1]
EC20  100nF  [C0402_1]
EC22  100nF  [C0402_1]
EC23  100nF  [C0402_3]
EC24  220nF  [C0402_1]
EC45  100nF  [C0402_1]
EC46  220nF  [C0402_1]
EC47  220nF  [C0402_1]
EC49  100nF  [C0402_1]
EC68  220nF  [C0402_1]
EC69  220nF  [C0402_1]
EC72  220nF  [C0402_1]
EC73  220nF  [C0402_1]
EC74  220nF  [C0402_1]
EC75  220nF  [C0402_1]
EC76  220nF  [C0402_1]
EC77  220nF  [C0402_1]
EC78  220nF  [C0402_1]
EC79  220nF  [C0402_1]
EC80  220nF  [C0402_1]
EC81  220nF  [C0402_1]
EC82  220nF  [C0402_1]
EC83  220nF  [C0402_1]
ECT20  270uF  [EC1P25C_2]
PC37  22uF  [C0603_3]
PC38  22uF  [C0603_3]
PC92  33pF  [C0402_3]
PCIEX1_1  value PCIEX1-36 PIN-B  [3GIO_X1-20060619]  (hidden comment: 3183-10200P1T)
PEX16_1  value PCIEX16-164 PIN LR-B  [3GIO_X16_AIR_KORTAK_AKL]  (hidden comment: 2EG78227-D2DL-4F)
PR193  1kΩ  [R0402]
PR194  3.2kΩ  [R0402_3]
PR195  1kΩ  [R0402_2]
PR199  1kΩ  [R0402_2]
PU9  value L11831AG PSOP8  [SO8_50_150GV_2]  (hidden comment: RT9173B_0)
YC59  100nF  [C0402_3]
YC60  100nF  [C0402_3]

### Ports
CLK_PCIE0 (bidir), CLK_PCIE0# (bidir), CLK_PCIE3 (in), CLK_PCIE3# (in), EXP_A_RX_0_DN (bidir), EXP_A_RX_0_DP (bidir), EXP_A_RX_1_DN (bidir), EXP_A_RX_1_DP (bidir), EXP_A_RX_2_DN (bidir), EXP_A_RX_2_DP (bidir), EXP_A_RX_3_DN (in), EXP_A_RX_3_DP (in), EXP_A_RX_4_DN (in), EXP_A_RX_4_DP (in), EXP_A_RX_5_DN (in), EXP_A_RX_5_DP (in), EXP_A_RX_6_DN (in), EXP_A_RX_6_DP (in), EXP_A_RX_7_DN (in), EXP_A_RX_7_DP (in), EXP_A_RX_8_DN (in), EXP_A_RX_8_DP (in), EXP_A_RX_9_DN (in), EXP_A_RX_9_DP (in), EXP_A_RX_10_DN (in), EXP_A_RX_10_DP (in), EXP_A_RX_11_DN (in), EXP_A_RX_11_DP (in), EXP_A_RX_12_DN (in), EXP_A_RX_12_DP (in), EXP_A_RX_13_DN (in), EXP_A_RX_13_DP (in), EXP_A_RX_14_DN (in), EXP_A_RX_14_DP (in), EXP_A_RX_15_DN (in), EXP_A_RX_15_DP (in), EXP_A_TX_0_DN (in), EXP_A_TX_0_DP (in), EXP_A_TX_1_DN (in), EXP_A_TX_1_DP (in), EXP_A_TX_2_DN (in), EXP_A_TX_2_DP (in), EXP_A_TX_3_DN (in), EXP_A_TX_3_DP (in), EXP_A_TX_4_DN (in), EXP_A_TX_4_DP (in), EXP_A_TX_5_DN (in), EXP_A_TX_5_DP (in), EXP_A_TX_6_DN (in), EXP_A_TX_6_DP (in), EXP_A_TX_7_DN (in), EXP_A_TX_7_DP (in), EXP_A_TX_8_DN (in), EXP_A_TX_8_DP (in), EXP_A_TX_9_DN (in), EXP_A_TX_9_DP (in), EXP_A_TX_10_DN (in), EXP_A_TX_10_DP (in), EXP_A_TX_11_DN (in), EXP_A_TX_11_DP (in), EXP_A_TX_12_DN (in), EXP_A_TX_12_DP (in), EXP_A_TX_13_DN (in), EXP_A_TX_13_DP (in), EXP_A_TX_14_DN (in), EXP_A_TX_14_DP (in), EXP_A_TX_15_DN (in), EXP_A_TX_15_DP (in), PCIE2_RXN (in), PCIE2_RXP (in), PCIE2_TXN (in), PCIE2_TXP (in), PCIE_RST# (in), PCIE_WAKE# (in), SMB_CLK (in), SMB_DATA (in), SRCCLKREQ0# (in), SRCCLKREQ3# (in)

### Nets
+3V3_AUX: EC45.1 EC49.1 PC37.1 PC38.1 PC92.2 PCIEX1_1.B10(+3.3VAUX) PEX16_1.B10(+3.3VAUX) PR194.1 PR199.1 PU9.6(VOUT)
+5V_DUAL: C245.1 PR193.1 PU9.3(VIN) PU9.4(CNTL)
GND: C245.2 EC17.2 EC20.2 EC22.2 EC23.2 EC45.2 EC49.2 ECT20.2 PC37.2 PC38.2 PCIEX1_1.A4(GND9) PCIEX1_1.A12(GND8) PCIEX1_1.A15(GND7) PCIEX1_1.A18(GND6) PCIEX1_1.B4(GND1) PCIEX1_1.B7(GND2) PCIEX1_1.B13(GND3) PCIEX1_1.B16(GND4) PCIEX1_1.B18(GND5) PEX16_1.A1(PRSNT1) PEX16_1.A4(GND68) PEX16_1.A12(GND67) PEX16_1.A15(GND66) PEX16_1.A18(GND65) PEX16_1.A20(GND64) PEX16_1.A23(GND63) PEX16_1.A24(GND62) PEX16_1.A27(GND61) PEX16_1.A28(GND60) PEX16_1.A31(GND59) PEX16_1.A34(GND58) PEX16_1.A37(GND57) PEX16_1.A38(GND56) PEX16_1.A41(GND55) PEX16_1.A42(GND54) PEX16_1.A45(GND53) PEX16_1.A46(GND52) PEX16_1.A49(GND51) PEX16_1.A51(GND50) PEX16_1.A54(GND49) PEX16_1.A55(GND48) PEX16_1.A58(GND47) PEX16_1.A59(GND46) PEX16_1.A62(GND45) PEX16_1.A63(GND44) PEX16_1.A66(GND43) PEX16_1.A67(GND42) PEX16_1.A70(GND41) PEX16_1.A71(GND40) PEX16_1.A74(GND39) PEX16_1.A75(GND38) PEX16_1.A78(GND37) PEX16_1.A79(GND36) PEX16_1.A82(GND35) PEX16_1.B4(GND1) PEX16_1.B7(GND2) PEX16_1.B13(GND3) PEX16_1.B16(GND4) PEX16_1.B18(GND5) PEX16_1.B21(GND6) PEX16_1.B22(GND7) PEX16_1.B25(GND8) PEX16_1.B26(GND9) PEX16_1.B29(GND10) PEX16_1.B32(GND11) PEX16_1.B35(GND12) PEX16_1.B36(GND13) PEX16_1.B39(GND14) PEX16_1.B40(GND15) PEX16_1.B43(GND16) PEX16_1.B44(GND17) PEX16_1.B47(GND18) PEX16_1.B49(GND19) PEX16_1.B52(GND20) PEX16_1.B53(GND21) PEX16_1.B56(GND22) PEX16_1.B57(GND23) PEX16_1.B60(GND24) PEX16_1.B61(GND25) PEX16_1.B64(GND26) PEX16_1.B65(GND27) PEX16_1.B68(GND28) PEX16_1.B69(GND29) PEX16_1.B72(GND30) PEX16_1.B73(GND31) PEX16_1.B76(GND32) PEX16_1.B77(GND33) PEX16_1.B80(GND34) PR195.2 PU9.8(GND) PU9.9(GND_PAD)
VCC3_3: EC20.1 EC22.1 PCIEX1_1.A9(+3.3V1) PCIEX1_1.A10(+3.3V2) PCIEX1_1.B8(+3.3V) PEX16_1.A9(+3.3V3) PEX16_1.A10(+3.3V2) PEX16_1.B8(+3.3V1)
VCC12: EC17.1 EC23.1 ECT20.1 PCIEX1_1.A2(+12V4) PCIEX1_1.A3(+12V5) PCIEX1_1.B1(+12V1) PCIEX1_1.B2(+12V2) PCIEX1_1.B3(+12V3) PEX16_1.A2(+12V5) PEX16_1.A3(+12V4) PEX16_1.B1(+12V1) PEX16_1.B2(+12V2) PEX16_1.B3(+12V3)
CLK_PCIE0: PEX16_1.A13(REFCLK+) ; port CLK_PCIE0
CLK_PCIE0#: PEX16_1.A14(REFCLK-) ; port CLK_PCIE0#
CLK_PCIE3: PCIEX1_1.A13(REFCLK+) ; port CLK_PCIE3
CLK_PCIE3#: PCIEX1_1.A14(REFCLK-) ; port CLK_PCIE3#
EXP_A_RX_2_DP: PEX16_1.A25(HSIP2) ; port EXP_A_RX_2_DP
EXP_A_RX_3_DN: PEX16_1.A30(HSIN3) ; port EXP_A_RX_3_DN
EXP_A_RX_3_DP: PEX16_1.A29(HSIP3) ; port EXP_A_RX_3_DP
EXP_A_RX_6_DN: PEX16_1.A44(HSIN6) ; port EXP_A_RX_6_DN
EXP_A_RX_6_DP: PEX16_1.A43(HSIP6) ; port EXP_A_RX_6_DP
EXP_A_RX_7_DN: PEX16_1.A48(HSIN7) ; port EXP_A_RX_7_DN
EXP_A_RX_8_DP: PEX16_1.A52(HSIP8) ; port EXP_A_RX_8_DP
EXP_A_RX_10_DP: PEX16_1.A60(HSIP10) ; port EXP_A_RX_10_DP
EXP_A_RX_11_DN: PEX16_1.A65(HSIN11) ; port EXP_A_RX_11_DN
EXP_A_RX_12_DP: PEX16_1.A68(HSIP12) ; port EXP_A_RX_12_DP
EXP_A_RX_13_DN: PEX16_1.A73(HSIN13) ; port EXP_A_RX_13_DN
EXP_A_RX_13_DP: PEX16_1.A72(HSIP13) ; port EXP_A_RX_13_DP
EXP_A_RX_14_DN: PEX16_1.A77(HSIN14) ; port EXP_A_RX_14_DN
EXP_A_RX_14_DP: PEX16_1.A76(HSIP14) ; port EXP_A_RX_14_DP
EXP_A_RX_15_DN: PEX16_1.A81(HSIN15) ; port EXP_A_RX_15_DN
EXP_A_RX_15_DP: PEX16_1.A80(HSIP15) ; port EXP_A_RX_15_DP
EXP_A_TX_1_DN: EC4.1 ; port EXP_A_TX_1_DN
EXP_A_TX_2_DN: EC6.1 ; port EXP_A_TX_2_DN
EXP_A_TX_2_DP: EC5.1 ; port EXP_A_TX_2_DP
EXP_A_TX_3_DN: EC8.1 ; port EXP_A_TX_3_DN
EXP_A_TX_3_DP: EC7.1 ; port EXP_A_TX_3_DP
EXP_A_TX_4_DN: EC10.1 ; port EXP_A_TX_4_DN
EXP_A_TX_5_DN: EC12.1 ; port EXP_A_TX_5_DN
EXP_A_TX_7_DN: EC46.1 ; port EXP_A_TX_7_DN
EXP_A_TX_8_DN: EC68.1 ; port EXP_A_TX_8_DN
EXP_A_TX_8_DP: EC72.1 ; port EXP_A_TX_8_DP
EXP_A_TX_9_DN: EC24.1 ; port EXP_A_TX_9_DN
EXP_A_TX_10_DP: EC76.1 ; port EXP_A_TX_10_DP
EXP_A_TX_11_DN: EC69.1 ; port EXP_A_TX_11_DN
EXP_A_TX_12_DN: EC77.1 ; port EXP_A_TX_12_DN
EXP_A_TX_12_DP: EC78.1 ; port EXP_A_TX_12_DP
PCIE2_RXN: PCIEX1_1.A17(HSIN0) ; port PCIE2_RXN
PCIE2_RXP: PCIEX1_1.A16(HSIP0) ; port PCIE2_RXP
PCIE2_TXN: YC60.1 ; port PCIE2_TXN
PCIE2_TXP: YC59.1 ; port PCIE2_TXP
PCIE_RST#: PCIEX1_1.A11(PWRGD) PEX16_1.A11(PWRGD) ; port PCIE_RST#
PCIE_WAKE#: PCIEX1_1.B11(WAKE*) PEX16_1.B11(WAKE) ; port PCIE_WAKE#
SMB_CLK: PCIEX1_1.B5(SMCLK) PEX16_1.B5(SMCLK) ; port SMB_CLK
SMB_DATA: PCIEX1_1.B6(SMDAT) PEX16_1.B6(SMDAT) ; port SMB_DATA
SRCCLKREQ0#: PEX16_1.B17(PRSNT2A) PEX16_1.B31(PRSNT2B) PEX16_1.B48(PRSNT2C) PEX16_1.B81(PRSNT2D) ; port SRCCLKREQ0#
SRCCLKREQ3#: PCIEX1_1.B17(PRSNT2*) ; port SRCCLKREQ3#
NetEC1_1: EC1.1 ; port EXP_A_TX_0_DP
NetEC1_2: EC1.2 PEX16_1.B14(HSOP0)
NetEC2_1: EC2.1 ; port EXP_A_TX_0_DN
NetEC2_2: EC2.2 PEX16_1.B15(HSON0)
NetEC3_1: EC3.1 ; port EXP_A_TX_1_DP
NetEC3_2: EC3.2 PEX16_1.B19(HSOP1)
NetEC4_2: EC4.2 PEX16_1.B20(HSON1)
NetEC5_2: EC5.2 PEX16_1.B23(HSOP2)
NetEC6_2: EC6.2 PEX16_1.B24(HSON2)
NetEC7_2: EC7.2 PEX16_1.B27(HSOP3)
NetEC8_2: EC8.2 PEX16_1.B28(HSON3)
NetEC9_1: EC9.1 ; port EXP_A_TX_4_DP
NetEC9_2: EC9.2 PEX16_1.B33(HSOP4)
NetEC10_2: EC10.2 PEX16_1.B34(HSON4)
NetEC11_1: EC11.1 ; port EXP_A_TX_5_DP
NetEC11_2: EC11.2 PEX16_1.B37(HSOP5)
NetEC12_2: EC12.2 PEX16_1.B38(HSON5)
NetEC13_1: EC13.1 ; port EXP_A_TX_6_DP
NetEC13_2: EC13.2 PEX16_1.B41(HSOP6)
NetEC14_1: EC14.1 ; port EXP_A_TX_6_DN
NetEC14_2: EC14.2 PEX16_1.B42(HSON6)
NetEC19_1: EC19.1 ; port EXP_A_TX_7_DP
NetEC19_2: EC19.2 PEX16_1.B45(HSOP7)
NetEC24_2: EC24.2 PEX16_1.B55(HSON9)
NetEC46_2: EC46.2 PEX16_1.B46(HSON7)
NetEC47_1: EC47.1 ; port EXP_A_TX_13_DN
NetEC47_2: EC47.2 PEX16_1.B71(HSON13)
NetEC68_2: EC68.2 PEX16_1.B51(HSON8)
NetEC69_2: EC69.2 PEX16_1.B63(HSON11)
NetEC72_2: EC72.2 PEX16_1.B50(HSOP8)
NetEC73_1: EC73.1 ; port EXP_A_TX_10_DN
NetEC73_2: EC73.2 PEX16_1.B59(HSON10)
NetEC74_1: EC74.1 ; port EXP_A_TX_9_DP
NetEC74_2: EC74.2 PEX16_1.B54(HSOP9)
NetEC75_1: EC75.1 ; port EXP_A_TX_11_DP
NetEC75_2: EC75.2 PEX16_1.B62(HSOP11)
NetEC76_2: EC76.2 PEX16_1.B58(HSOP10)
NetEC77_2: EC77.2 PEX16_1.B67(HSON12)
NetEC78_2: EC78.2 PEX16_1.B66(HSOP12)
NetEC79_1: EC79.1 ; port EXP_A_TX_15_DN
NetEC79_2: EC79.2 PEX16_1.B79(HSON15)
NetEC80_1: EC80.1 ; port EXP_A_TX_14_DN
NetEC80_2: EC80.2 PEX16_1.B75(HSON14)
NetEC81_1: EC81.1 ; port EXP_A_TX_13_DP
NetEC81_2: EC81.2 PEX16_1.B70(HSOP13)
NetEC82_1: EC82.1 ; port EXP_A_TX_15_DP
NetEC82_2: EC82.2 PEX16_1.B78(HSOP15)
NetEC83_1: EC83.1 ; port EXP_A_TX_14_DP
NetEC83_2: EC83.2 PEX16_1.B74(HSOP14)
NetPC92_1: PC92.1 PR194.2 PR195.1 PU9.7(FB)
NetPCIEX1_1_B14: PCIEX1_1.B14(HSOP0) YC59.2
NetPCIEX1_1_B15: PCIEX1_1.B15(HSON0) YC60.2
NetPEX16_1_A16: PEX16_1.A16(HSIP0) ; port EXP_A_RX_0_DP
NetPEX16_1_A17: PEX16_1.A17(HSIN0) ; port EXP_A_RX_0_DN
NetPEX16_1_A21: PEX16_1.A21(HSIP1) ; port EXP_A_RX_1_DP
NetPEX16_1_A22: PEX16_1.A22(HSIN1) ; port EXP_A_RX_1_DN
NetPEX16_1_A26: PEX16_1.A26(HSIN2) ; port EXP_A_RX_2_DN
NetPEX16_1_A35: PEX16_1.A35(HSIP4) ; port EXP_A_RX_4_DP
NetPEX16_1_A36: PEX16_1.A36(HSIN4) ; port EXP_A_RX_4_DN
NetPEX16_1_A39: PEX16_1.A39(HSIP5) ; port EXP_A_RX_5_DP
NetPEX16_1_A40: PEX16_1.A40(HSIN5) ; port EXP_A_RX_5_DN
NetPEX16_1_A47: PEX16_1.A47(HSIP7) ; port EXP_A_RX_7_DP
NetPEX16_1_A53: PEX16_1.A53(HSIN8) ; port EXP_A_RX_8_DN
NetPEX16_1_A56: PEX16_1.A56(HSIP9) ; port EXP_A_RX_9_DP
NetPEX16_1_A57: PEX16_1.A57(HSIN9) ; port EXP_A_RX_9_DN
NetPEX16_1_A61: PEX16_1.A61(HSIN10) ; port EXP_A_RX_10_DN
NetPEX16_1_A64: PEX16_1.A64(HSIP11) ; port EXP_A_RX_11_DP
NetPEX16_1_A69: PEX16_1.A69(HSIN12) ; port EXP_A_RX_12_DN
NetPR193_2: PR193.2 PU9.2(EN)
NetPR199_2: PR199.2 PU9.1(POK)

Not connected (* = marked no-connect by the designer): PCIEX1_1 A1(PRSNT1*) A5(JTAG2) A6(JTAG3) A7(JTAG4) A8(JTAG5) B9(JTAG1) B12(RSVD) NC1 NC2; PEX16_1 A5(JTAG2) A6(JTAG3) A7(JTAG4) A8(JTAG5) A19(RSVD7) A32(RSVD6) A33(RSVD5) A50(RSVD4) B9(JTAG1) B12(RSVD1) B30(RSVD2) B82(RSVD3) G1 G2 G3 G4; PU9 5(NC)

### Notes on the sheet
- (near PU9) 2A
- R2
- Vout=Vref (0.8V) X ( R2/R1+1 )
- R1
- 更新日期
- 2025-10-09
- 原理图
- 图页
- SCHEMATIC1_1
- PEG/PCIEX1 SLOT
- 创建日期
- 物料编码
- 审阅
- 绘制
- 【全网首发】X86电脑主板_copy
- 版本
- V1.0
- 尺寸
- A3
- 页
- 0
- 嘉立创EDA
- 共
- 17
- (in symbol 2EG78227-D2DL-4F) KEY
- (in symbol 160AREC271M0609) +
- (in symbol 3183-10200P1T) KEY

### Library data of the parts
C245 = CL10A226MQ8NRNC_1: 容值:22uF;精度:±20%;额定电压:6.3V;材质(温度系数):X5R;; Manufacturer: SAMSUNG(三星); 3D Model: ac125912035d415993ca9572d50418b1; Symbol: CAP; PCB Footprint: C0603; Tolerance: ±20%; AddInBom: yes; Voltage Rated: 6.3V; ModelName: C0603_L1.6-W0.8-H0.8; ModelTransform: 62.992,31.496,0,0,0,0,0,0,0; Temperature Coefficient: X5R; Device: CL10A226MQ8NRNC_1; Value: 22uF; Supplier: LCSC; Datasheet: https://atta.szlcsc.com/upload/public/pdf/source/20160103/1457707740762.pdf; FootprintName: C0603_2; SupplierPart: C59461; ConvertToPcb: yes; LCSC Part Name: 22uF ±20% 6.3V; JLCPCB Part Class: Basic Part; ManufacturerPart: CL10A226MQ8NRNC; Supplier Footprint: 0603
EC1-EC14 EC19 EC46 = CL05B224KO5NNNC: 容值:220nF;精度:±10%;额定电压:16V;材质(温度系数):X7R;; Manufacturer: SAMSUNG(三星); Symbol: CAP; PCB Footprint: C0402; Tolerance: ±10%; ModelId: 36a51122f27c49738f86b3bfa98863e0; AddInBom: yes; Voltage Rated: 16V; ModelName: C0402_L1.0-W0.5-H0.5; ModelTransform: 39.37,19.685,0,0,0,0,0,0,0; Temperature Coefficient: X7R; Device: CL05B224KO5NNNC; Value: 220nF; Supplier: LCSC; Datasheet: https://atta.szlcsc.com/upload/public/pdf/source/20160103/1457707689724.pdf; FootprintName: C0402_1; SupplierPart: C16772; ConvertToPcb: yes; LCSC Part Name: 220nF ±10% 16V; JLCPCB Part Class: Basic Part; ManufacturerPart: CL05B224KO5NNNC; Supplier Footprint: 0402
EC17 EC20 EC22 EC23 EC45 EC49 YC59 YC60 = CL05B104KO5NNNC: 容值:100nF;精度:±10%;额定电压:16V;材质(温度系数):X7R;; Manufacturer: SAMSUNG(三星); Symbol: CAP; PCB Footprint: C0402; Tolerance: ±10%; ModelId: 36a51122f27c49738f86b3bfa98863e0; AddInBom: yes; Voltage Rated: 16V; ModelName: C0402_L1.0-W0.5-H0.5; ModelTransform: 39.37,19.685,0,0,0,0,0,0,0; Temperature Coefficient: X7R; Device: CL05B104KO5NNNC; Value: 100nF; Supplier: LCSC; Datasheet: https://atta.szlcsc.com/upload/public/pdf/source/20160103/1457707674891.pdf; SupplierPart: C1525; ConvertToPcb: yes; LCSC Part Name: 100nF ±10% 16V; JLCPCB Part Class: Basic Part; ManufacturerPart: CL05B104KO5NNNC; Supplier Footprint: 0402
  EC17 EC20 EC22 EC45 EC49: FootprintName: C0402_1
  EC23 YC59 YC60: FootprintName: C0402_3
EC24 EC47 EC68 EC69 EC72-EC83 = CL05B224KO5NNNC: as EC57 on sheet M.2_SATA_SLOT; Device: CL05B224KO5NNNC; Value: 220nF; Supplier: LCSC; Datasheet: https://atta.szlcsc.com/upload/public/pdf/source/20160103/1457707689724.pdf; FootprintName: C0402_1; SupplierPart: C16772; ConvertToPcb: yes; LCSC Part Name: 220nF ±10% 16V; JLCPCB Part Class: Basic Part; ManufacturerPart: CL05B224KO5NNNC; Supplier Footprint: 0402
ECT20 = 160AREC271M0609: as MCT12 on sheet PCH_PWR - 0.82V_1.05V_1.8V; Device: 160AREC271M0609; Value: 270uF; LCSC Part Name: 270uF ±20% 16V; SupplierPart: C176312; ManufacturerPart: 160AREC271M0609; Supplier Footprint: 插件,D6.3xL9mm; JLCPCB Part Class: Extended Part; Datasheet: https://atta.szlcsc.com/upload/public/pdf/source/20180420/C176312_A6CC051F3F5535015096354530D22B11.pdf; Supplier: LCSC; ConvertToPcb: yes; FootprintName: EC1P25C_2; Ripple Current: 3.8A@100kHz; Equivalent Series Resistance(ESR): 15mΩ@100kHz~300kHz; Type: -; Lead Spacing: 2.5mm; Operating Temperature: -55℃~+105℃
PC37 PC38 = CL10A226MQ8NRNC: as C330 on sheet M.2_SATA_SLOT; Device: CL10A226MQ8NRNC; Value: 22uF; LCSC Part Name: 22uF ±20% 6.3V; SupplierPart: C59461; ManufacturerPart: CL10A226MQ8NRNC; Supplier Footprint: 0603; JLCPCB Part Class: Basic Part; Datasheet: https://atta.szlcsc.com/upload/public/pdf/source/20160218/1457707763339.pdf; Supplier: LCSC; ConvertToPcb: yes; FootprintName: C0603_3
PC92 = CC0402JRNPO9BN330: as PC26 on sheet PCH_PWR - 0.82V_1.05V_1.8V; Device: CC0402JRNPO9BN330; Value: 33pF; Supplier: LCSC; Datasheet: https://atta.szlcsc.com/upload/public/pdf/source/20171026/C107005_15089856307561059550.pdf; FootprintName: C0402_3; SupplierPart: C107005; ConvertToPcb: yes; LCSC Part Name: 33pF ±5% 50V; JLCPCB Part Class: Extended Part; ManufacturerPart: CC0402JRNPO9BN330; Supplier Footprint: 0402
PCIEX1_1 = 3183-10200P1T: 连接器类型:PCI-E;间距:1mm;引脚总数:36P;安装方式:直插;工作温度范围:-;; Manufacturer: UMaxconn; Symbol: 3GPIOX1_1; Pitch: 1mm; ModelId: 31107a67ea9241f2923ada2e205807af; AddInBom: yes; ModelName: CONN-TH_36P-P1.00-V_3183-XXXXXPXT; Connector Type: PCI-E; ModelTransform: 984.25,346.456,0,0,0,0,0,-25.591,-177.165; Device: 3183-10200P1T; Supplier: LCSC; Datasheet: https://atta.szlcsc.com/upload/public/pdf/source/20221109/DBCA7DEED61952BFBF0AC75AC3B44CB1.pdf; FootprintName: 3GIO_X1-20060619; SupplierPart: C404113; ConvertToPcb: yes; LCSC Part Name: PCI-E 1mm P数:36P 镀金G/F 黑色; Mounting Style: 直插; Number of Pins: 36P; JLCPCB Part Class: Extended Part; ManufacturerPart: 3183-10200P1T; Height Above Board: 11.25mm; Supplier Footprint: 插件,P=1mm; Operating Temperature Range: -
PEX16_1 = 2EG78227-D2DL-4F: 连接器类型:PCI-E;间距:1mm;引脚总数:164P;安装方式:直插;工作温度范围:-40℃~+105℃;; Manufacturer: FOXCONN(富士康); Symbol: 3GPIOX16_1; AddInBom: yes; ModelId: dfc542c144e148ca86ecc4ff4264af27; ModelName: PCIE-TH_2EG78227-D2DL-4F; ModelTransform: 4153.535,530.9,0,0,0,0,324.802,62.992,-177.165; Connector Type: PCI-E; Pitch: 1mm; Device: 2EG78227-D2DL-4F; LCSC Part Name: 1mm P数:164P; SupplierPart: C2839835; ManufacturerPart: 2EG78227-D2DL-4F; Supplier Footprint: 插件,P=1mm; JLCPCB Part Class: Extended Part; Datasheet: https://atta.szlcsc.com/upload/public/pdf/source/20210616/C2839835_C40EC9904ACFAD2927B1FE81A9713DE3.pdf; Supplier: LCSC; ConvertToPcb: yes; FootprintName: 3GIO_X16_AIR_KORTAK_AKL; Number of Pins: 164P; Mounting Style: 直插; Height Above Board: 11mm; Operating Temperature Range: -40℃~+105℃
PR193 = 0402WGF1001TCE: as PR23 on sheet PCH_PWR - 0.82V_1.05V_1.8V; Device: 0402WGF1001TCE; Value: 1kΩ; Type: 厚膜电阻; Supplier: LCSC; Datasheet: https://atta.szlcsc.com/upload/public/pdf/source/20200306/C422600_1E6D84923E4A46A82E41ADD87F860B5C.pdf; FootprintName: R0402; SupplierPart: C11702; ConvertToPcb: yes; LCSC Part Name: 1kΩ ±1% 62.5mW; JLCPCB Part Class: Basic Part; ManufacturerPart: 0402WGF1001TCE; Supplier Footprint: 0402; Operating Temperature Range: -55℃~+155℃
PR194 = RT0402BRD073K2L: 电阻类型:薄膜电阻;阻值:3.2kΩ;精度:±0.1%;功率:62.5mW;最大工作电压:50V;温度系数:±25ppm/℃;; Manufacturer: YAGEO(国巨); Symbol: R-0603; AddInBom: yes; ModelId: 671aefced39d4c318694bba8bd8efd39; ModelName: R0402_L1.0-W0.5-H0.5; ModelTransform: 39.37,19.685,0,0,0,0,0,0.0005,0; Tolerance: ±0.1%; Power(Watts): 62.5mW; Overload Voltage (Max): 50V; Device: RT0402BRD073K2L; Value: 3.2kΩ; LCSC Part Name: 薄膜电阻 3.2kΩ ±0.1% 62.5mW; SupplierPart: C705066; ManufacturerPart: RT0402BRD073K2L; Supplier Footprint: 0402; JLCPCB Part Class: Extended Part; Datasheet: https://atta.szlcsc.com/upload/public/pdf/source/20200720/C705066_AC9A8CDCFD7D351B8891536FAAAB5B91.pdf; Supplier: LCSC; ConvertToPcb: yes; FootprintName: R0402_3; Type: 薄膜电阻; Temperature Coefficient: ±25ppm/℃; Operating Temperature Range: -55℃~+155℃
PR195 PR199 = 0402WGF1001TCE: as LR4 on sheet LAN - RTL8111H; Device: 0402WGF1001TCE; Value: 1kΩ; Type: 厚膜电阻; Supplier: LCSC; Datasheet: https://atta.szlcsc.com/upload/public/pdf/source/20200306/C422600_1E6D84923E4A46A82E41ADD87F860B5C.pdf; FootprintName: R0402_2; SupplierPart: C11702; ConvertToPcb: yes; LCSC Part Name: 1kΩ ±1% 62.5mW; JLCPCB Part Class: Basic Part; ManufacturerPart: 0402WGF1001TCE; Supplier Footprint: 0402; Operating Temperature Range: -55℃~+155℃
PU9 = RT9173B_3: Check: false; AddInBom: yes; Device: RT9173B_3; Symbol: RT9173B_0; FootprintName: SO8_50_150GV_2; ConvertToPcb: yes